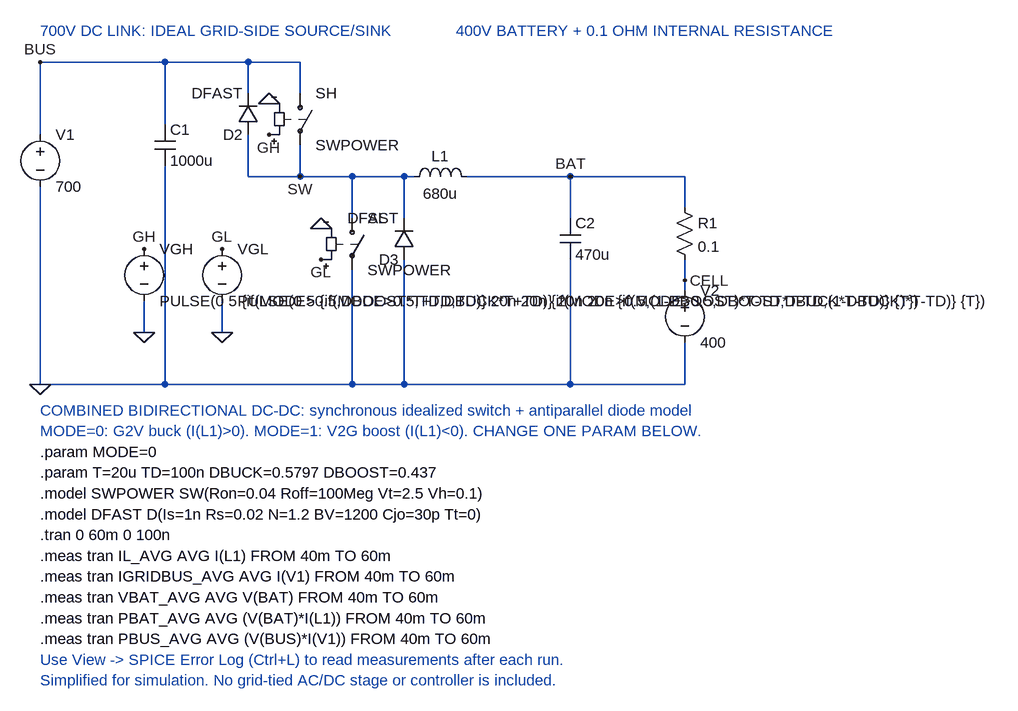
[diagram p0: schematic combined_bidirectional.asc]
combined_bidirectional.asc, the LTspice schematic file:
Version 4.1
SHEET 1 1510 1200
WIRE 272 64 80 64
WIRE 400 64 272 64
WIRE 480 64 400 64
WIRE 80 176 80 64
WIRE 272 160 272 64
WIRE 400 112 400 64
WIRE 480 112 480 64
WIRE 80 560 80 256
WIRE 272 560 272 224
WIRE 400 240 400 176
WIRE 480 240 480 192
WIRE 480 240 400 240
WIRE 560 240 480 240
WIRE 640 240 560 240
WIRE 656 240 640 240
WIRE 560 304 560 240
WIRE 560 560 560 384
WIRE 640 304 640 240
WIRE 640 560 640 368
WIRE 896 240 736 240
WIRE 1072 240 896 240
WIRE 896 304 896 240
WIRE 896 560 896 368
WIRE 1072 288 1072 240
WIRE 1072 416 1072 368
WIRE 1072 560 1072 496
WIRE 272 560 80 560
WIRE 560 560 272 560
WIRE 640 560 560 560
WIRE 896 560 640 560
WIRE 1072 560 896 560
WIRE 240 480 240 432
WIRE 360 480 360 432
FLAG 80 64 BUS
FLAG 80 560 0
FLAG 480 240 SW
FLAG 896 240 BAT
FLAG 1072 400 CELL
FLAG 432 128 0
FLAG 432 176 GH
FLAG 512 320 0
FLAG 512 368 GL
FLAG 240 352 GH
FLAG 240 480 0
FLAG 360 352 GL
FLAG 360 480 0
SYMBOL voltage 80 160 R0
SYMATTR InstName V1
SYMATTR Value 700
SYMBOL cap 256 160 R0
SYMATTR InstName C1
SYMATTR Value 1000u
SYMBOL diode 416 176 R180
SYMATTR InstName D2
SYMATTR Value DFAST
SYMBOL sw 480 96 R0
SYMATTR InstName SH
SYMATTR Value SWPOWER
SYMBOL sw 560 288 R0
SYMATTR InstName SL
SYMATTR Value SWPOWER
SYMBOL diode 656 368 R180
SYMATTR InstName D3
SYMATTR Value DFAST
SYMBOL ind 640 256 R270
WINDOW 0 32 56 VTop 2
WINDOW 3 5 56 VBottom 2
SYMATTR InstName L1
SYMATTR Value 680u
SYMBOL cap 880 304 R0
SYMATTR InstName C2
SYMATTR Value 470u
SYMBOL res 1056 272 R0
SYMATTR InstName R1
SYMATTR Value 0.1
SYMBOL voltage 1072 400 R0
SYMATTR InstName V2
SYMATTR Value 400
SYMBOL voltage 240 336 R0
SYMATTR InstName VGH
SYMATTR Value PULSE(0 5 {if(MODE>0.5,DBOOST*T+TD,TD)} 20n 20n {if(MODE>0.5,(1-DBOOST)*T-TD,DBUCK*T-TD)} {T})
SYMBOL voltage 360 336 R0
SYMATTR InstName VGL
SYMATTR Value PULSE(0 5 {if(MODE>0.5,TD,DBUCK*T+TD)} 20n 20n {if(MODE>0.5,DBOOST*T-TD,(1-DBUCK)*T-TD)} {T})
TEXT 80 16 Left 2 ;700V DC LINK: IDEAL GRID-SIDE SOURCE/SINK
TEXT 720 16 Left 2 ;400V BATTERY + 0.1 OHM INTERNAL RESISTANCE
TEXT 80 600 Left 2 ;COMBINED BIDIRECTIONAL DC-DC: synchronous idealized switch + antiparallel diode model
TEXT 80 632 Left 2 ;MODE=0: G2V buck (I(L1)>0). MODE=1: V2G boost (I(L1)<0). CHANGE ONE PARAM BELOW.
TEXT 80 664 Left 2 !.param MODE=0
TEXT 80 696 Left 2 !.param T=20u TD=100n DBUCK=0.5797 DBOOST=0.437
TEXT 80 728 Left 2 !.model SWPOWER SW(Ron=0.04 Roff=100Meg Vt=2.5 Vh=0.1)
TEXT 80 760 Left 2 !.model DFAST D(Is=1n Rs=0.02 N=1.2 BV=1200 Cjo=30p Tt=0)
TEXT 80 792 Left 2 !.tran 0 60m 0 100n
TEXT 80 824 Left 2 !.meas tran IL_AVG AVG I(L1) FROM 40m TO 60m
TEXT 80 856 Left 2 !.meas tran IGRIDBUS_AVG AVG I(V1) FROM 40m TO 60m
TEXT 80 888 Left 2 !.meas tran VBAT_AVG AVG V(BAT) FROM 40m TO 60m
TEXT 80 920 Left 2 !.meas tran PBAT_AVG AVG (V(BAT)*I(L1)) FROM 40m TO 60m
TEXT 80 952 Left 2 !.meas tran PBUS_AVG AVG (V(BUS)*I(V1)) FROM 40m TO 60m
TEXT 80 984 Left 2 ;Use View -> SPICE Error Log (Ctrl+L) to read measurements after each run.
TEXT 80 1016 Left 2 ;Simplified for simulation. No grid-tied AC/DC stage or controller is included.

The netlist it stands for:
* combined_bidirectional.asc
V1 BUS 0 700
C1 BUS 0 1000u
D2 SW BUS DFAST
SH BUS SW GH 0 SWPOWER
SL SW 0 GL 0 SWPOWER
D3 0 SW DFAST
L1 SW BAT 680u
C2 BAT 0 470u
R1 BAT CELL 0.1
V2 CELL 0 400
VGH GH 0 PULSE(0 5 {if(MODE>0.5,DBOOST*T+TD,TD)} 20n 20n {if(MODE>0.5,(1-DBOOST)*T-TD,DBUCK*T-TD)} {T})
VGL GL 0 PULSE(0 5 {if(MODE>0.5,TD,DBUCK*T+TD)} 20n 20n {if(MODE>0.5,DBOOST*T-TD,(1-DBUCK)*T-TD)} {T})
.model D D
.lib standard.dio
* 700V DC LINK: IDEAL GRID-SIDE SOURCE/SINK
* 400V BATTERY + 0.1 OHM INTERNAL RESISTANCE
* COMBINED BIDIRECTIONAL DC-DC: synchronous idealized switch + antiparallel diode model
* MODE=0: G2V buck (I(L1)>0). MODE=1: V2G boost (I(L1)<0). CHANGE ONE PARAM BELOW.
.param MODE=0
.param T=20u TD=100n DBUCK=0.5797 DBOOST=0.437
.model SWPOWER SW(Ron=0.04 Roff=100Meg Vt=2.5 Vh=0.1)
.model DFAST D(Is=1n Rs=0.02 N=1.2 BV=1200 Cjo=30p Tt=0)
.tran 0 60m 0 100n
.meas tran IL_AVG AVG I(L1) FROM 40m TO 60m
.meas tran IGRIDBUS_AVG AVG I(V1) FROM 40m TO 60m
.meas tran VBAT_AVG AVG V(BAT) FROM 40m TO 60m
.meas tran PBAT_AVG AVG (V(BAT)*I(L1)) FROM 40m TO 60m
.meas tran PBUS_AVG AVG (V(BUS)*I(V1)) FROM 40m TO 60m
* Use View -> SPICE Error Log (Ctrl+L) to read measurements after each run.
* Simplified for simulation. No grid-tied AC/DC stage or controller is included.
.backanno
.end